# Altium schematic sheet 基准电压TL431电路分析.SchDoc
size 1651 x 1651 mm; SheetNumber: 5; SheetTotal: 14
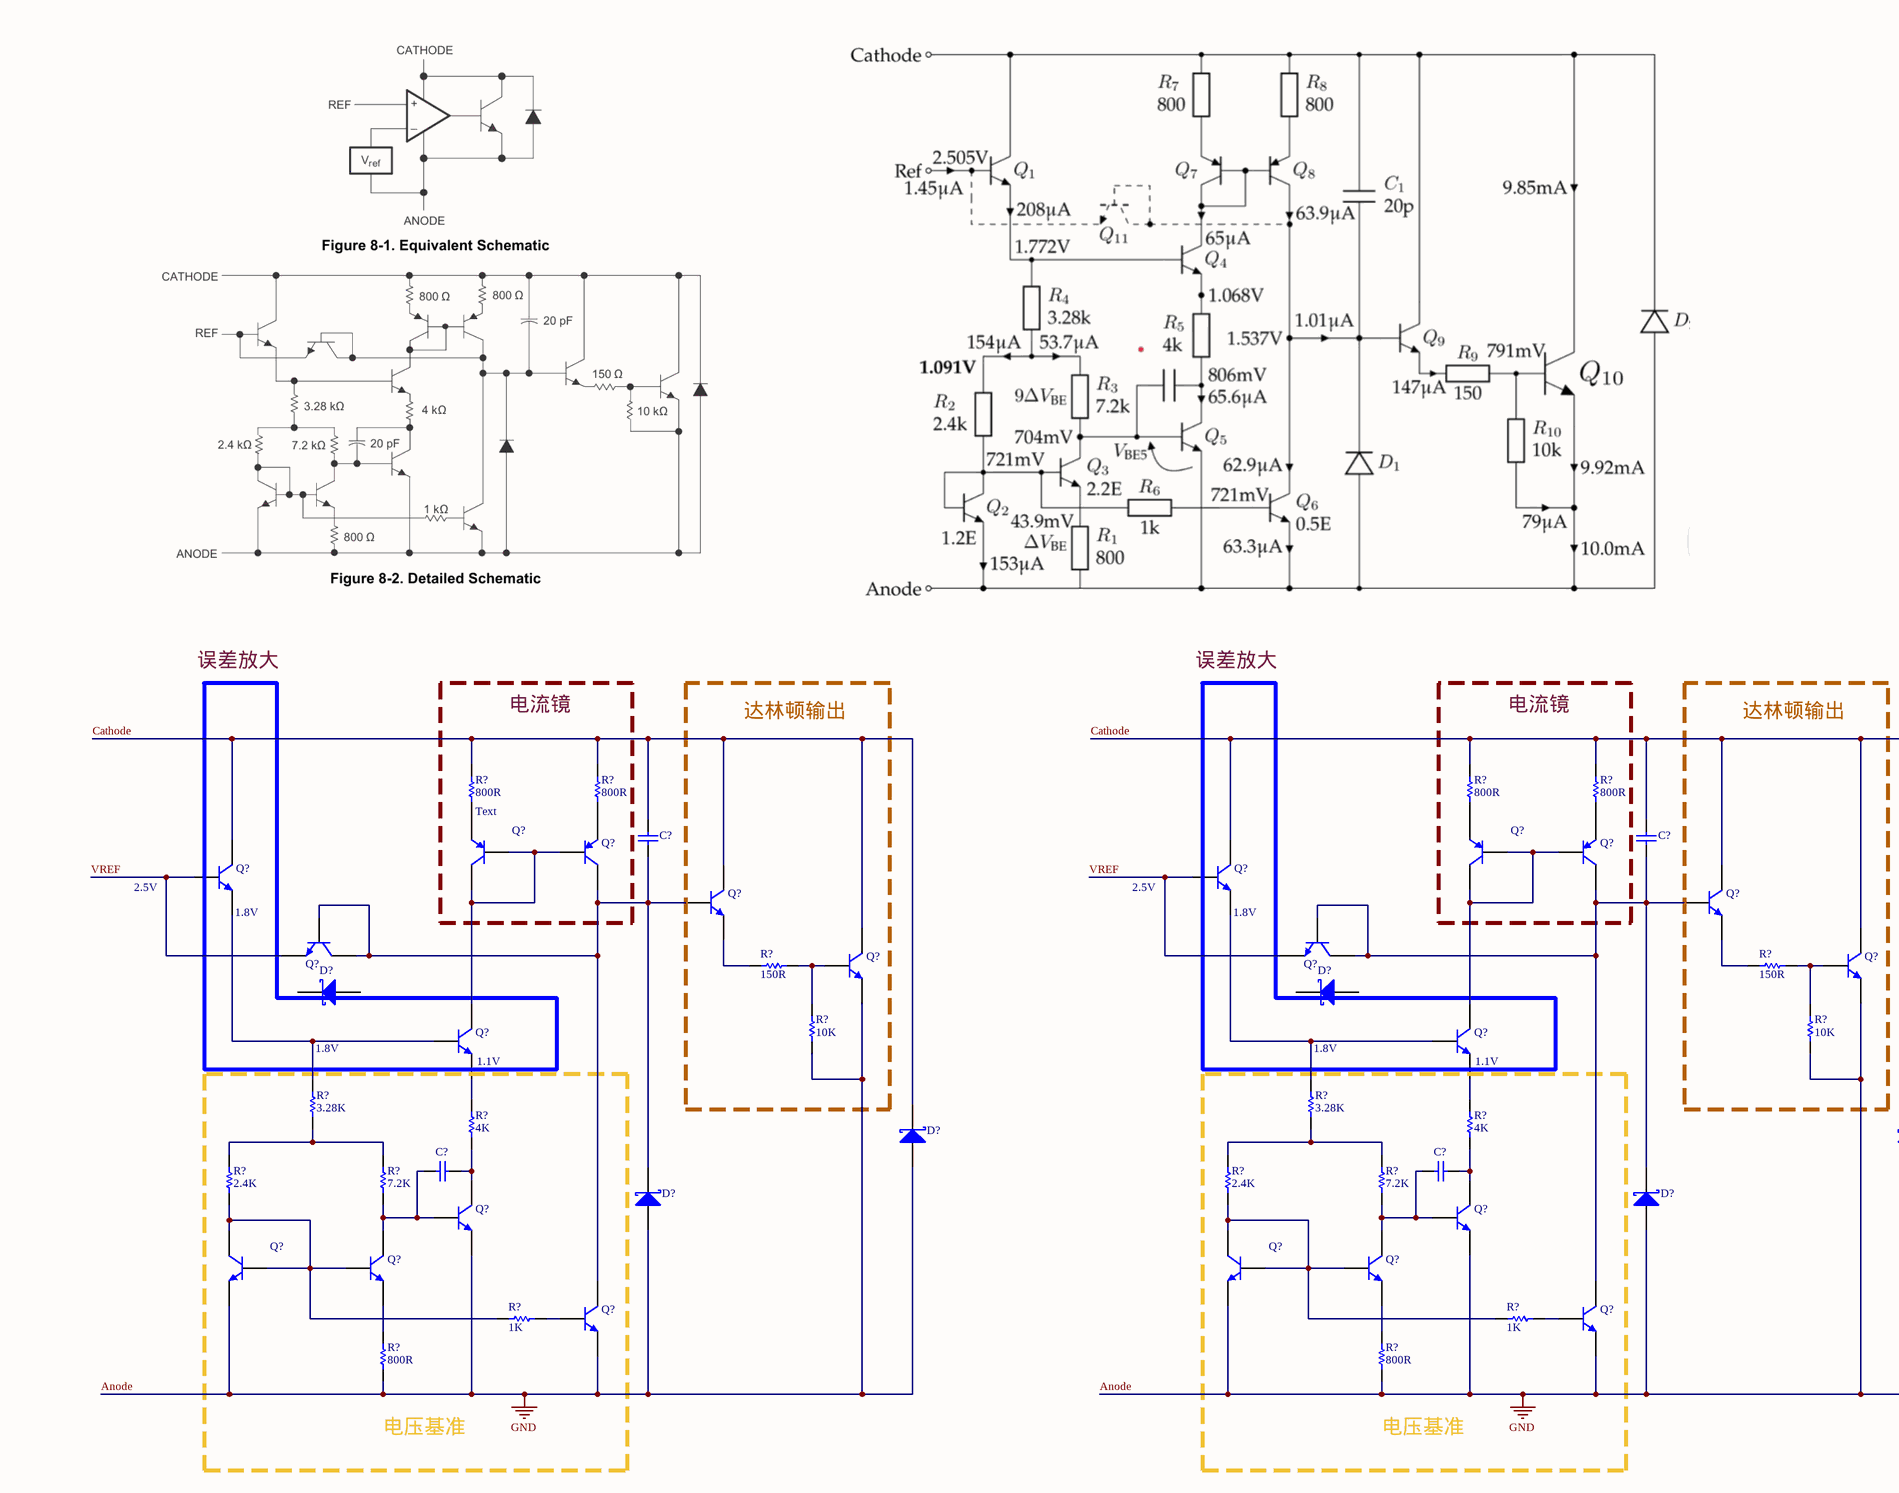
[diagram p0: 基准电压TL431电路分析.SchDoc, top left]
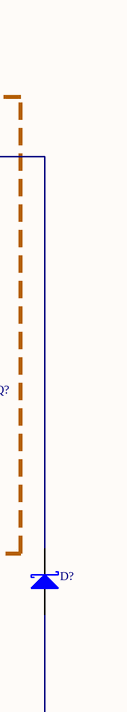
[diagram p1: 基准电压TL431电路分析.SchDoc, top right]
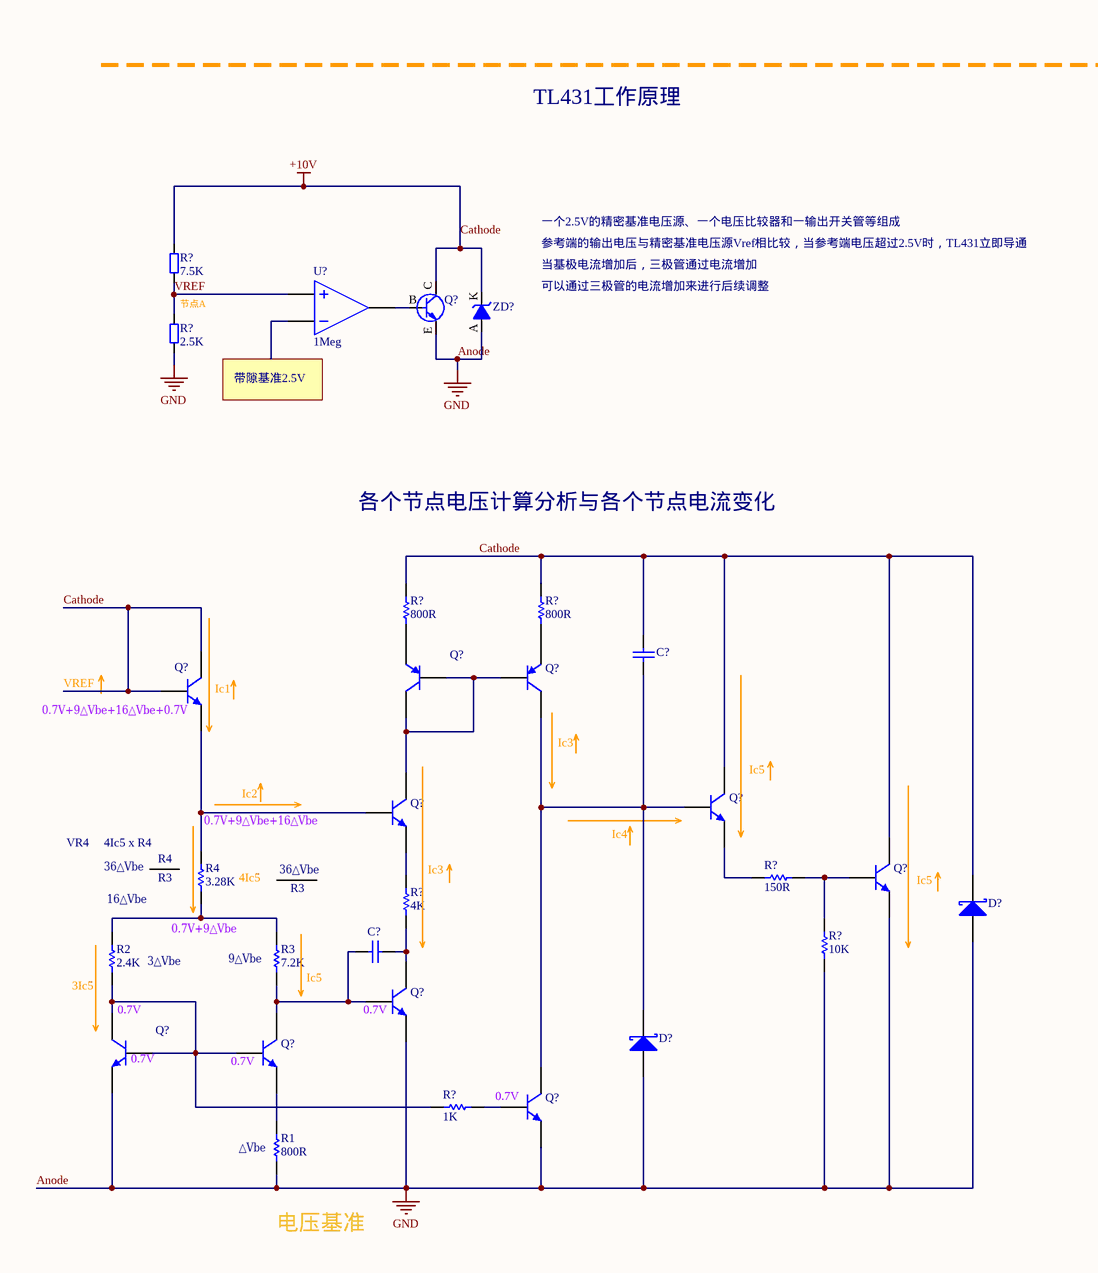
[diagram p2: 基准电压TL431电路分析.SchDoc, bottom left]

## Parts
(Parts that share a designator on the sheet are numbered #1, #2 ... from top to bottom, then left to right.)
C?#1  Capacitor  (value not drawn)
C?#2  Capacitor  (value not drawn)
C?#3  Capacitor  (value not drawn)
C?#4  Capacitor  (value not drawn)
C?#5  Capacitor  (value not drawn)
C?#6  Capacitor  (value not drawn)
D?#1  Schottky Diode  (value not drawn)
D?#2  Schottky Diode  (value not drawn)
D?#3  Schottky Diode  (value not drawn)
D?#4  Schottky Diode  (value not drawn)
D?#5  Schottky Diode  (value not drawn)
D?#6  Schottky Diode  (value not drawn)
D?#7  Schottky Diode  (value not drawn)
D?#8  Schottky Diode  (value not drawn)
Q?#1  Bipolar PNP 3 Pins Transistor Gummel-Poon Model  (value not drawn)
Q?#2  Bipolar PNP 3 Pins Transistor Gummel-Poon Model  (value not drawn)
Q?#3  Bipolar PNP 3 Pins Transistor Gummel-Poon Model  (value not drawn)
Q?#4  Bipolar PNP 3 Pins Transistor Gummel-Poon Model  (value not drawn)
Q?#5  Bipolar NPN 3 Pins Transistor Gummel-Poon Model  (value not drawn)
Q?#6  Bipolar NPN 3 Pins Transistor Gummel-Poon Model  (value not drawn)
Q?#7  Bipolar NPN 3 Pins Transistor Gummel-Poon Model  (value not drawn)
Q?#8  Bipolar NPN 3 Pins Transistor Gummel-Poon Model  (value not drawn)
Q?#9  Bipolar NPN 3 Pins Transistor Gummel-Poon Model  (value not drawn)
Q?#10  Bipolar NPN 3 Pins Transistor Gummel-Poon Model  (value not drawn)
Q?#11  Bipolar NPN 3 Pins Transistor Gummel-Poon Model  (value not drawn)
Q?#12  Bipolar NPN 3 Pins Transistor Gummel-Poon Model  (value not drawn)
Q?#13  Bipolar NPN 3 Pins Transistor Gummel-Poon Model  (value not drawn)
Q?#14  Bipolar NPN 3 Pins Transistor Gummel-Poon Model  (value not drawn)
Q?#15  Bipolar NPN 3 Pins Transistor Gummel-Poon Model  (value not drawn)
Q?#16  Bipolar NPN 3 Pins Transistor Gummel-Poon Model  (value not drawn)
Q?#17  Bipolar NPN 3 Pins Transistor Gummel-Poon Model  (value not drawn)
Q?#18  Bipolar NPN 3 Pins Transistor Gummel-Poon Model  (value not drawn)
Q?#19  Bipolar NPN 3 Pins Transistor Gummel-Poon Model  (value not drawn)
Q?#20  Bipolar NPN 3 Pins Transistor Gummel-Poon Model  (value not drawn)
Q?#21  Bipolar NPN 3 Pins Transistor Gummel-Poon Model  (value not drawn)
Q?#22  Bipolar NPN 3 Pins Transistor Gummel-Poon Model  (value not drawn)
Q?#23  MMTB3904  [SOT-23]  (value not drawn)
Q?#24  Bipolar PNP 3 Pins Transistor Gummel-Poon Model  (value not drawn)
Q?#25  Bipolar PNP 3 Pins Transistor Gummel-Poon Model  (value not drawn)
Q?#26  Bipolar NPN 3 Pins Transistor Gummel-Poon Model  (value not drawn)
Q?#27  Bipolar NPN 3 Pins Transistor Gummel-Poon Model  (value not drawn)
Q?#28  Bipolar NPN 3 Pins Transistor Gummel-Poon Model  (value not drawn)
Q?#29  Bipolar NPN 3 Pins Transistor Gummel-Poon Model  (value not drawn)
Q?#30  Bipolar NPN 3 Pins Transistor Gummel-Poon Model  (value not drawn)
Q?#31  Bipolar NPN 3 Pins Transistor Gummel-Poon Model  (value not drawn)
Q?#32  Bipolar NPN 3 Pins Transistor Gummel-Poon Model  (value not drawn)
Q?#33  Bipolar NPN 3 Pins Transistor Gummel-Poon Model  (value not drawn)
R1  value 800R  (hidden comment: Resistor)
R2  value 2.4K  (hidden comment: Resistor)
R3  value 7.2K  (hidden comment: Resistor)
R4  value 3.28K  (hidden comment: Resistor)
R?#1  value 800R  (hidden comment: Resistor)
R?#2  value 800R  (hidden comment: Resistor)
R?#3  value 800R  (hidden comment: Resistor)
R?#4  value 800R  (hidden comment: Resistor)
R?#5  value 150R  (hidden comment: Resistor)
R?#6  value 150R  (hidden comment: Resistor)
R?#7  value 10K  (hidden comment: Resistor)
R?#8  value 10K  (hidden comment: Resistor)
R?#9  value 3.28K  (hidden comment: Resistor)
R?#10  value 3.28K  (hidden comment: Resistor)
R?#11  value 4K  (hidden comment: Resistor)
R?#12  value 4K  (hidden comment: Resistor)
R?#13  value 2.4K  (hidden comment: Resistor)
R?#14  value 7.2K  (hidden comment: Resistor)
R?#15  value 2.4K  (hidden comment: Resistor)
R?#16  value 7.2K  (hidden comment: Resistor)
R?#17  value 1K  (hidden comment: Resistor)
R?#18  value 1K  (hidden comment: Resistor)
R?#19  value 800R  (hidden comment: Resistor)
R?#20  value 800R  (hidden comment: Resistor)
R?#21  7.5K  [R-0805]
R?#22  2.5K  [R-0805]
R?#23  value 800R  (hidden comment: Resistor)
R?#24  value 800R  (hidden comment: Resistor)
R?#25  value 150R  (hidden comment: Resistor)
R?#26  value 10K  (hidden comment: Resistor)
R?#27  value 4K  (hidden comment: Resistor)
R?#28  value 1K  (hidden comment: Resistor)
U?  GAIN: 1Meg  (hidden comment: Ideal Operational Amplifier)
ZD?  BZT52C18  [SOD123F]  (value not drawn)

## Blocks framed on the sheet
电流镜: Q?#1 Q?#2 R?#1 R?#2
达林顿输出: Q?#7 Q?#11 R?#5 R?#7
电流镜: Q?#3 Q?#4 R?#3 R?#4
达林顿输出: Q?#8 Q?#12 R?#6 R?#8
电压基准: C?#3 Q?#15 Q?#17 Q?#18 Q?#21 R?#9 R?#11 R?#13 R?#14 R?#17 R?#19
电压基准: C?#4 Q?#16 Q?#19 Q?#20 Q?#22 R?#10 R?#12 R?#15 R?#16 R?#18 R?#20

## Nets
Anode: D?#3.1(A) D?#4.1(A) D?#5.1(A) D?#6.1(A) D?#7.1(A) D?#8.1(A) Q?#11.3(E) Q?#12.3(E) Q?#15.3(E) Q?#16.3(E) Q?#17.3(E) Q?#19.3(E) Q?#21.3(E) Q?#22.3(E) Q?#23.E Q?#29.3(E) Q?#30.3(E) Q?#31.3(E) Q?#33.3(E) R1.1 R?#7.2 R?#8.2 R?#19.1 R?#20.1 R?#22.1 R?#26.2 ZD?.A  [also labelled GND]
Cathode: C?#1.2 C?#2.2 C?#5.2 D?#3.2(K) D?#4.2(K) D?#7.2(K) Q?#5.1(C) Q?#5.2(B) Q?#6.1(C) Q?#6.2(B) Q?#7.1(C) Q?#8.1(C) Q?#9.3(E) Q?#10.3(E) Q?#11.1(C) Q?#12.1(C) Q?#23.C Q?#26.1(C) Q?#26.2(B) Q?#27.1(C) Q?#29.1(C) R?#1.2 R?#2.2 R?#3.2 R?#4.2 R?#21.1 R?#21.2 R?#22.2 R?#23.2 R?#24.2 U?.2(IN+) ZD?.K  [also labelled +10V, VREF]
NetC?#1_1: C?#1.1 D?#5.2(K) Q?#2.1(C) Q?#7.2(B) Q?#9.1(C) Q?#9.2(B) Q?#21.1(C)
NetC?#2_1: C?#2.1 D?#6.2(K) Q?#4.1(C) Q?#8.2(B) Q?#10.1(C) Q?#10.2(B) Q?#22.1(C)
NetC?#3_1: C?#3.1 Q?#15.2(B) Q?#18.1(C) R?#14.1
NetC?#3_2: C?#3.2 Q?#15.1(C) R?#11.1
NetC?#4_1: C?#4.1 Q?#16.2(B) Q?#20.1(C) R?#16.1
NetC?#4_2: C?#4.2 Q?#16.1(C) R?#12.1
NetC?#5_1: C?#5.1 D?#8.2(K) Q?#25.1(C) Q?#27.2(B) Q?#33.1(C)
NetC?#6_1: C?#6.1 Q?#30.2(B) Q?#32.1(C) R3.1
NetC?#6_2: C?#6.2 Q?#30.1(C) R?#27.1
NetQ?#1_1: Q?#1.1(C) Q?#1.2(B) Q?#2.2(B) Q?#13.1(C)
NetQ?#1_3: Q?#1.3(E) R?#1.1
NetQ?#2_3: Q?#2.3(E) R?#2.1
NetQ?#3_1: Q?#3.1(C) Q?#3.2(B) Q?#4.2(B) Q?#14.1(C)
NetQ?#3_3: Q?#3.3(E) R?#3.1
NetQ?#4_3: Q?#4.3(E) R?#4.1
NetQ?#5_3: Q?#5.3(E) Q?#13.2(B) R?#9.2
NetQ?#6_3: Q?#6.3(E) Q?#14.2(B) R?#10.2
NetQ?#7_3: Q?#7.3(E) R?#5.2
NetQ?#8_3: Q?#8.3(E) R?#6.2
NetQ?#11_2: Q?#11.2(B) R?#5.1 R?#7.1
NetQ?#12_2: Q?#12.2(B) R?#6.1 R?#8.1
NetQ?#13_3: Q?#13.3(E) R?#11.2
NetQ?#14_3: Q?#14.3(E) R?#12.2
NetQ?#17_1: Q?#17.1(C) Q?#17.2(B) Q?#18.2(B) R?#13.1 R?#17.2
NetQ?#18_3: Q?#18.3(E) R?#19.2
NetQ?#19_1: Q?#19.1(C) Q?#19.2(B) Q?#20.2(B) R?#15.1 R?#18.2
NetQ?#20_3: Q?#20.3(E) R?#20.2
NetQ?#21_2: Q?#21.2(B) R?#17.1
NetQ?#22_2: Q?#22.2(B) R?#18.1
NetQ?#23_B: Q?#23.B U?.3(OUT)
NetQ?#24_1: Q?#24.1(C) Q?#24.2(B) Q?#25.2(B) Q?#28.1(C)
NetQ?#24_3: Q?#24.3(E) R?#23.1
NetQ?#25_3: Q?#25.3(E) R?#24.1
NetQ?#26_3: Q?#26.3(E) Q?#28.2(B) R4.2
NetQ?#27_3: Q?#27.3(E) R?#25.2
NetQ?#28_3: Q?#28.3(E) R?#27.2
NetQ?#29_2: Q?#29.2(B) R?#25.1 R?#26.1
NetQ?#31_1: Q?#31.1(C) Q?#31.2(B) Q?#32.2(B) R2.1 R?#28.2
NetQ?#32_3: Q?#32.3(E) R1.2
NetQ?#33_2: Q?#33.2(B) R?#28.1
NetR2_2: R2.2 R3.2 R4.1
NetR?#9_1: R?#9.1 R?#13.2 R?#14.2
NetR?#10_1: R?#10.1 R?#15.2 R?#16.2

Not connected (* = marked no-connect by the designer): D?#1 1(A) 2(K); D?#2 1(A) 2(K); U? 1(IN-)

## Notes on the sheet
- 误差放大
- (near R?#1) Text
- 2.5V
- (near Q?#5) 1.8V
- (near Q?#6) 1.8V
- 1.8V
- (near Q?#13) 1.1V
- (near Q?#14) 1.1V
- TL431工作原理
- 一个2.5V的精密基准电压源、一个电压比较器和一输出开关管等组成
- 参考端的输出电压与精密基准电压源Vref相比较，当参考端电压超过2.5V时，TL431立即导通
- 当基极电流增加后，三极管通过电流增加
- (near R?#22) 节点A
- 可以通过三极管的电流增加来进行后续调整
- 带隙基准2.5V
- 各个节点电压计算分析与各个节点电流变化
- (near Q?#26) 0.7V+9△Vbe+16△Vbe+0.7V
- (near Q?#26) Ic1
- (near Q?#25) Ic3
- Ic2
- (near Q?#27) Ic5
- VR4
- (near R4) 4Ic5 x R4
- 36△Vbe
- (near R4) R3
- (near R4) R4
- (near R4) 0.7V+9△Vbe+16△Vbe
- (near R4) 4Ic5
- (near R?#27) Ic3
- Ic4
- Ic5
- 16△Vbe
- 0.7V+9△Vbe
- (near R3) R3
- (near R2) 3Ic5
- 0.7V
- (near R2) 3△Vbe
- (near R3) 9△Vbe
- (near Q?#30) 0.7V
- (near Q?#31) 0.7V
- (near Q?#32) 0.7V
- (near R1) △Vbe
- (near Q?#33) 0.7V
- (near R1) 电压基准

## Library data of the parts
C?#1-C?#6 = Capacitor: SimulationGenericComponent: True
D?#1-D?#8 = Schottky Diode: AF: 1; BV: 0; BV_MAX: 1e99; EG: 1.11; FC: 0.5; IBV: 0.001; IS: 1e-14; MJSW: 0.33; NTUN: 30; TNOM: 27; XTI: 3; SimulationGenericComponent: True; CJO: 0; CJP: 0; CTA: 0; CTP: 0; FCS: 0.5; FV_MAX: 1e99; IKF: 0; IKR: 0; ISR: 1e-14; JSW: 0; JTUN: 0; JTUNSW: 0; KEG: 1; KF: 0; LEVEL: 1; N: 1; NBV: 1; NR: 1; NS: 1; PHP: 1; RS: 0; TCV: 0; TLEV: 0; TLEVC: 0; TM1: 0; TM2: 0; TPB: 0; TPHP: 0; TRS: 0; TRS2: 0; TT: 0; TTT1: 0; TTT2: 0; VJ: 1; XTITUN: 3
Q?#1-Q?#4 Q?#24 Q?#25 = BJT PNP GP: BF: 100; AF: 0; BR: 1; EG: 1.11; FC: 0.5; IS: 1e-16; MJC: 0.33; NC: 2; NE: 1.5; TNOM: 27; VBC_MAX: 1e99; VJC: 0.75; XTI: 3; SimulationGenericComponent: True; CJC: 0; CJE: 0; CJS: 0; CTC: 0; CTE: 0; CTS: 0; IKF: 0; IKR: 0; IRB: 0; ISC: 0; ISE: 0; ISS: 0; ITF: 0; KF: 0; MJE: 0.33; MJS: 0; NF: 1; NKF: 0.5; NR: 1; NS: 1; PTF: 0; RB: 0; RBM: 0; RC: 0; RE: 0; SUBS: 1; TBF1: 0; TBF2: 0; TBR1: 0; TBR2: 0; TF: 0; TIKF1: 0; TIKF2: 0; TIKR1: 0; TIKR2: 0; TIRB1: 0; TIRB2: 0; TIS1: 0; TIS2: 0; TISC1: 0; TISC2: 0; TISE1: 0; TISE2: 0; TITF1: 0; TITF2: 0; TLEV: 0; TLEVC: 0; TMJC1: 0; TMJC2: 0; TMJE1: 0; TMJE2: 0; TMJS1: 0; TMJS2: 0; TNC1: 0; TNC2: 0; TNE1: 0; TNE2: 0; TNF1: 0; TNF2: 0; TNR1: 0; TNR2: 0; TNS1: 0; TNS2: 0; TR: 0; TRB1: 0; TRB2: 0; TRC1: 0; TRC2: 0; TRE1: 0; TRE2: 0; TRM1: 0; TRM2: 0; TTF1: 0; TTF2: 0; TTR1: 0; TTR2: 0; TVAF1: 0; TVAF2: 0; TVAR1: 0; TVAR2: 0; TVJC: 0; TVJE: 0; TVJS: 0; VAF: 0; VAR: 0; VBE_MAX: 1e99; VCE_MAX: 1e99; VJE: 0.75; VJS: 0.75; VTF: 0; XCJC: 1; XTB: 0; XTF: 0
Q?#5-Q?#22 Q?#26-Q?#33 = BJT NPN_GP: SimulationGenericComponent: True; BF: 100; AF: 0; BR: 1; EG: 1.11; FC: 0.5; IS: 1e-16; MJC: 0.33; NC: 2; NE: 1.5; TNOM: 27; VBC_MAX: 1e99; VJC: 0.75; XTI: 3; CJC: 0; CJE: 0; CJS: 0; CTC: 0; CTE: 0; CTS: 0; IKF: 0; IKR: 0; IRB: 0; ISC: 0; ISE: 0; ISS: 0; ITF: 0; KF: 0; MJE: 0.33; MJS: 0; NF: 1; NKF: 0.5; NR: 1; NS: 1; PTF: 0; RB: 0; RBM: 0; RC: 0; RE: 0; SUBS: 1; TBF1: 0; TBF2: 0; TBR1: 0; TBR2: 0; TF: 0; TIKF1: 0; TIKF2: 0; TIKR1: 0; TIKR2: 0; TIRB1: 0; TIRB2: 0; TIS1: 0; TIS2: 0; TISC1: 0; TISC2: 0; TISE1: 0; TISE2: 0; TITF1: 0; TITF2: 0; TLEV: 0; TLEVC: 0; TMJC1: 0; TMJC2: 0; TMJE1: 0; TMJE2: 0; TMJS1: 0; TMJS2: 0; TNC1: 0; TNC2: 0; TNE1: 0; TNE2: 0; TNF1: 0; TNF2: 0; TNR1: 0; TNR2: 0; TNS1: 0; TNS2: 0; TR: 0; TRB1: 0; TRB2: 0; TRC1: 0; TRC2: 0; TRE1: 0; TRE2: 0; TRM1: 0; TRM2: 0; TTF1: 0; TTF2: 0; TTR1: 0; TTR2: 0; TVAF1: 0; TVAF2: 0; TVAR1: 0; TVAR2: 0; TVJC: 0; TVJE: 0; TVJS: 0; VAF: 0; VAR: 0; VBE_MAX: 1e99; VCE_MAX: 1e99; VJE: 0.75; VJS: 0.75; VTF: 0; XCJC: 1; XTB: 0; XTF: 0
Q?#23 = BJT_NPN_1: Part Number: *; Brand: *
R1-R4 R?#1-R?#20 R?#23-R?#28 = Resistor: TC1: 0; SimulationGenericComponent: True; TC2: 0
R?#21 R?#22 = R-0603-100Ω-5%_16: 片式电阻; 物料描述: 片式电阻器-0805-10KΩ-5%-JT; 物料号: NA
U? = OpAmp: SimulationGenericComponent: True
ZD? = DIO_ZENER_1: Brand: 10V; Part Number: *